# Altium schematic sheet push-button-switch-2.SchDoc
size A4; SheetNumber: 2; SheetTotal: 17
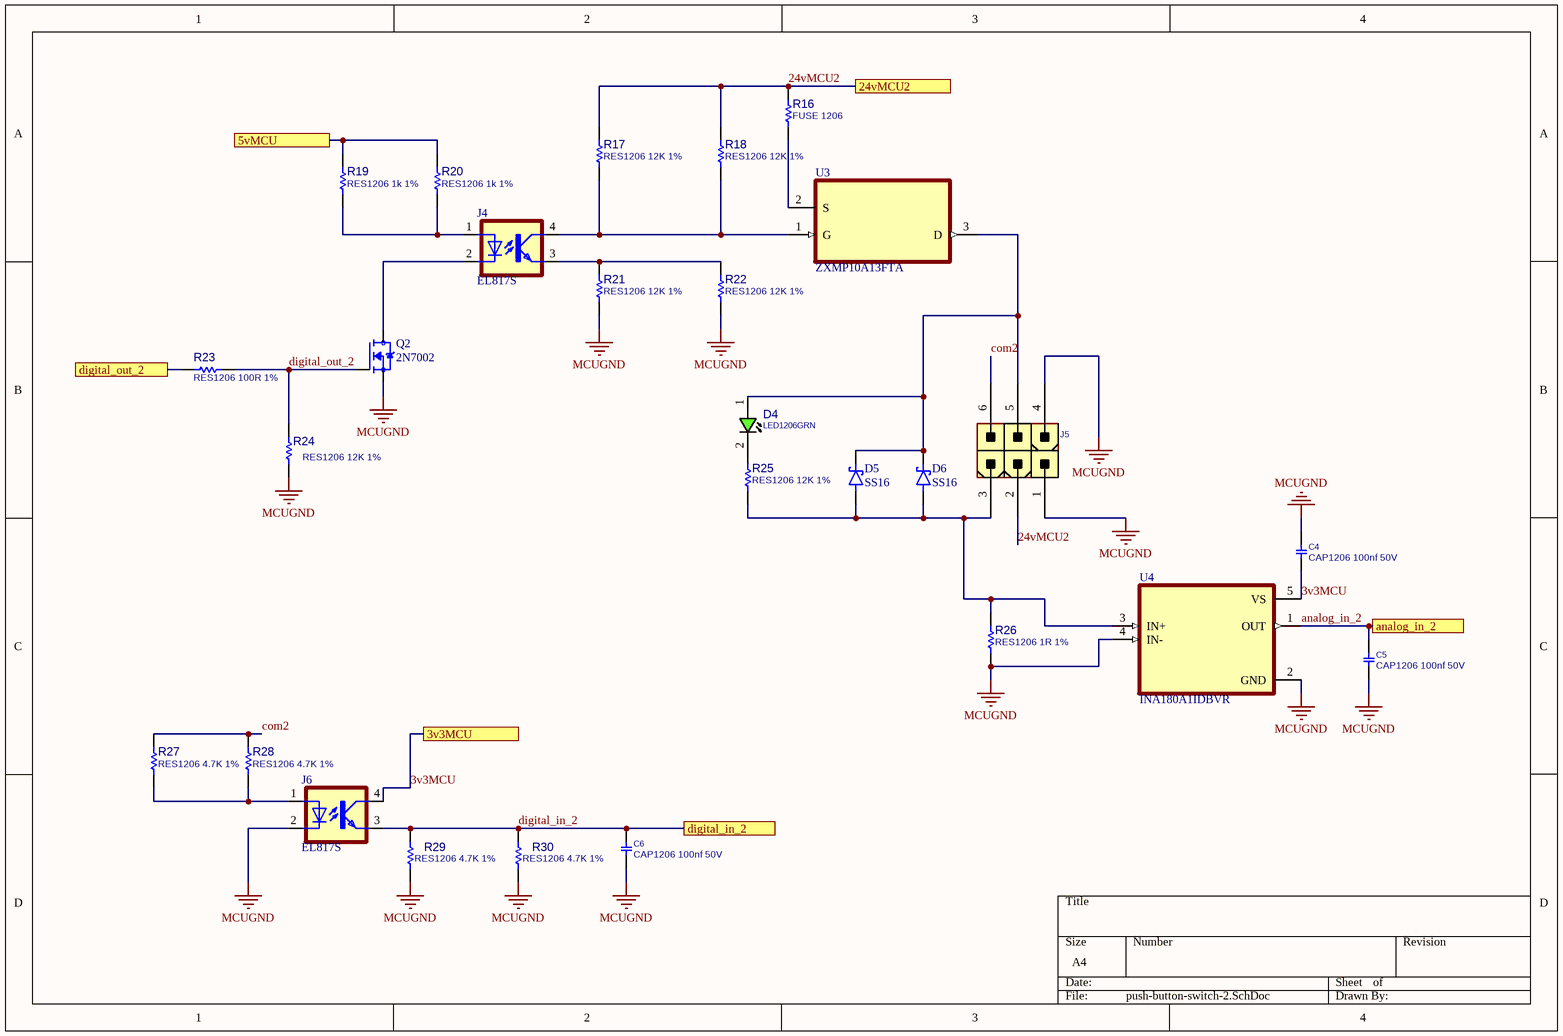
[diagram p0: push-button-switch-2.SchDoc]

## Parts
C4  CAP1206 100nf 50V  [C1206]
C5  CAP1206 100nf 50V  [C1206]
C6  CAP1206 100nf 50V  [C1206]
D4  LED1206GRN  [LED1206GRN]
D5  SS16  [DIOM4325X250N]
D6  SS16  [DIOM4325X250N]
J4  EL817S  [SOIC254P1030X460-4N]
J5  CONN_ATXPWR_6  [ATXPWR_6]  (value not drawn)
J6  EL817S  [SOIC254P1030X460-4N]
Q2  2N7002  [SOT95P240X111-3N]
R16  FUSE 1206  [R1206]
R17  RES1206 12K 1%  [R1206]
R18  RES1206 12K 1%  [R1206]
R19  RES1206 1k 1%  [R1206]
R20  RES1206 1k 1%  [R1206]
R21  RES1206 12K 1%  [R1206]
R22  RES1206 12K 1%  [R1206]
R23  RES1206 100R 1%  [R1206]
R24  RES1206 12K 1%  [R1206]
R25  RES1206 12K 1%  [R1206]
R26  RES1206 1R 1%  [R1206]
R27  RES1206 4.7K 1%  [R1206]
R28  RES1206 4.7K 1%  [R1206]
R29  RES1206 4.7K 1%  [R1206]
R30  RES1206 4.7K 1%  [R1206]
U3  ZXMP10A13FTA  [SOT95P230X110-3N]
U4  INA180A1IDBVR  [SOT95P280X145-5N]

## Ports
3v3MCU, 5vMCU, 24vMCU2, analog_in_2, digital_in_2, digital_out_2

## Nets
MCUGND: C4.1 C5.2 C6.2 J5.1 J5.4 J6.2(C) Q2.2(S) R21.2 R22.2 R24.2 R26.2 R29.1 R30.1 U4.2(GND) U4.4(IN-)
3v3MCU: C4.2 J6.4(COL) U4.5(VS) ; port 3v3MCU
5vMCU: R19.2 R20.2 ; port 5vMCU
24vMCU2: J5.2 R16.1 R17.1 R18.1 ; port 24vMCU2
analog_in_2: C5.1 U4.1(OUT) ; port analog_in_2
com2: J5.6 R27.2 R28.2
digital_in_2: C6.1 J6.3(EMIT) R29.2 R30.2 ; port digital_in_2
digital_out_2: Q2.1(G) R23.2 R24.1
digital_out_2: R23.1 ; port digital_out_2  [a separate net that carries the same name]
NetD4_1: D4.1(ANODE) D5.C(K) D6.C(K) J5.5 U3.3(D)
NetD4_2: D4.2(CATHODE) R25.1
NetD5_A: D5.A D6.A J5.3 R25.2 R26.1 U4.3(IN+)
NetJ4_1: J4.1(A) R19.1 R20.1
NetJ4_2: J4.2(C) Q2.3(D)
NetJ4_3: J4.3(EMIT) R21.1 R22.1
NetJ4_4: J4.4(COL) R17.2 R18.2 U3.1(G)
NetJ6_1: J6.1(A) R27.1 R28.1
NetR16_2: R16.2 U3.2(S)

## Library data of the parts
C4-C6 = CAP_SMD_MLCC_1206: CAP, MLCC; PARAM: -, -%; MANF_P#: MANF_PART#; PARAM2: -V; PRICE: 100= 1$; MANF: -; ASSEMBLY: ASSEMBLY
D4 = LED_SMD_1206_GRN: LED, SMD, 1206, GREEN; PARAM: 20mA; DESC: DESCRIPTION; PARAM2: 2.2V; MANF: -; ASSEMBLY: ASSEMBLY; PRICE: 36t@Javan; MANF_P#: -; VALUE: LED1206GRN; MountType: SMT; PartType: LED
D5 D6 = SS14: 1A, 40V, Schottky Rectifier; MF: Taiwan Semiconductor; SnapEDA_Link: https://www.snapeda.com/parts/SS14/taiwan/view-part/?ref=snap; Package: SMA-2 Taiwan Semiconductor; Value: *; MP: SS14; Check_prices: https://www.snapeda.com/parts/SS14/taiwan/view-part/?ref=eda
J4 J6 = EL817S: Optoisolator Transistor Output 5000Vrms 1 Channel 4-SMD; MF: Everlight Electronics; SnapEDA_Link: https://www.snapeda.com/parts/EL817S/Everlight+Electronics+Co+Ltd/view-part/?ref=snap; Package: SMD-4 Everlight Electronics Co Ltd; Value: *; MP: EL817S; Check_prices: https://www.snapeda.com/parts/EL817S/Everlight+Electronics+Co+Ltd/view-part/?ref=eda
J5 = CONN_ATXPWR_6: CONN, ATX POWER, 6 P; MANF: TE; MANF_P#: 4-1775099-1; VALUE: CONN_ATXPWR_6; MountType: THD; PACKAGE: ATXPWR-6pin; Part Type: Conn.
Q2 = 2N7002: N-Channel 60V 280mA (Ta) 350mW (Ta) Surface Mount SOT-23-3 (TO-236); MF: {'manufacturer': u'onsemi'}; Package: None; Price: None; Value: *; MP: 2N7002; Availability: Unavailable
R16-R30 = RES_SMD_1206: RESISTOR, SMD; PARAM: 1%, 0.25W; DESC: DESCRIPTION; DIST#: MOUSER; MANF_P#: -; MANF: -; ASSEMBLY: ASSEMBLY; PRICE: -; PARAM2: -
U3 = ZXMP10A13FTA: P-Channel 100 V 600mA (Ta) 625mW (Ta) Surface Mount SOT-23-3; MF: Diodes Inc.; Purchase-URL: https://pricing.snapeda.com/search/part/ZXMP10A13FTA/?ref=eda; Package: SOT-23-3 Diodes Inc.; SnapEDA_Link: https://www.snapeda.com/parts/ZXMP10A13FTA/Diodes+Inc./view-part/?ref=snap; Availability: In Stock; Value: *; MP: ZXMP10A13FTA; Check_prices: https://www.snapeda.com/parts/ZXMP10A13FTA/Diodes+Inc./view-part/?ref=eda; Price: None
U4 = INA180A1IDBVR: 26V, 350kHz current sense amplifier; MF: Texas Instruments; SnapEDA_Link: https://www.snapeda.com/parts/INA180A1IDBVR/Texas+Instruments/view-part/?ref=snap; Package: SOT-23-5 Texas Instruments; Value: *; MP: INA180A1IDBVR; Check_prices: https://www.snapeda.com/parts/INA180A1IDBVR/Texas+Instruments/view-part/?ref=eda